# Altium schematic sheet УШЯИ411618.029 Э3 Лист3п(схема задания уровня).SchDoc
size 420 x 297 mm
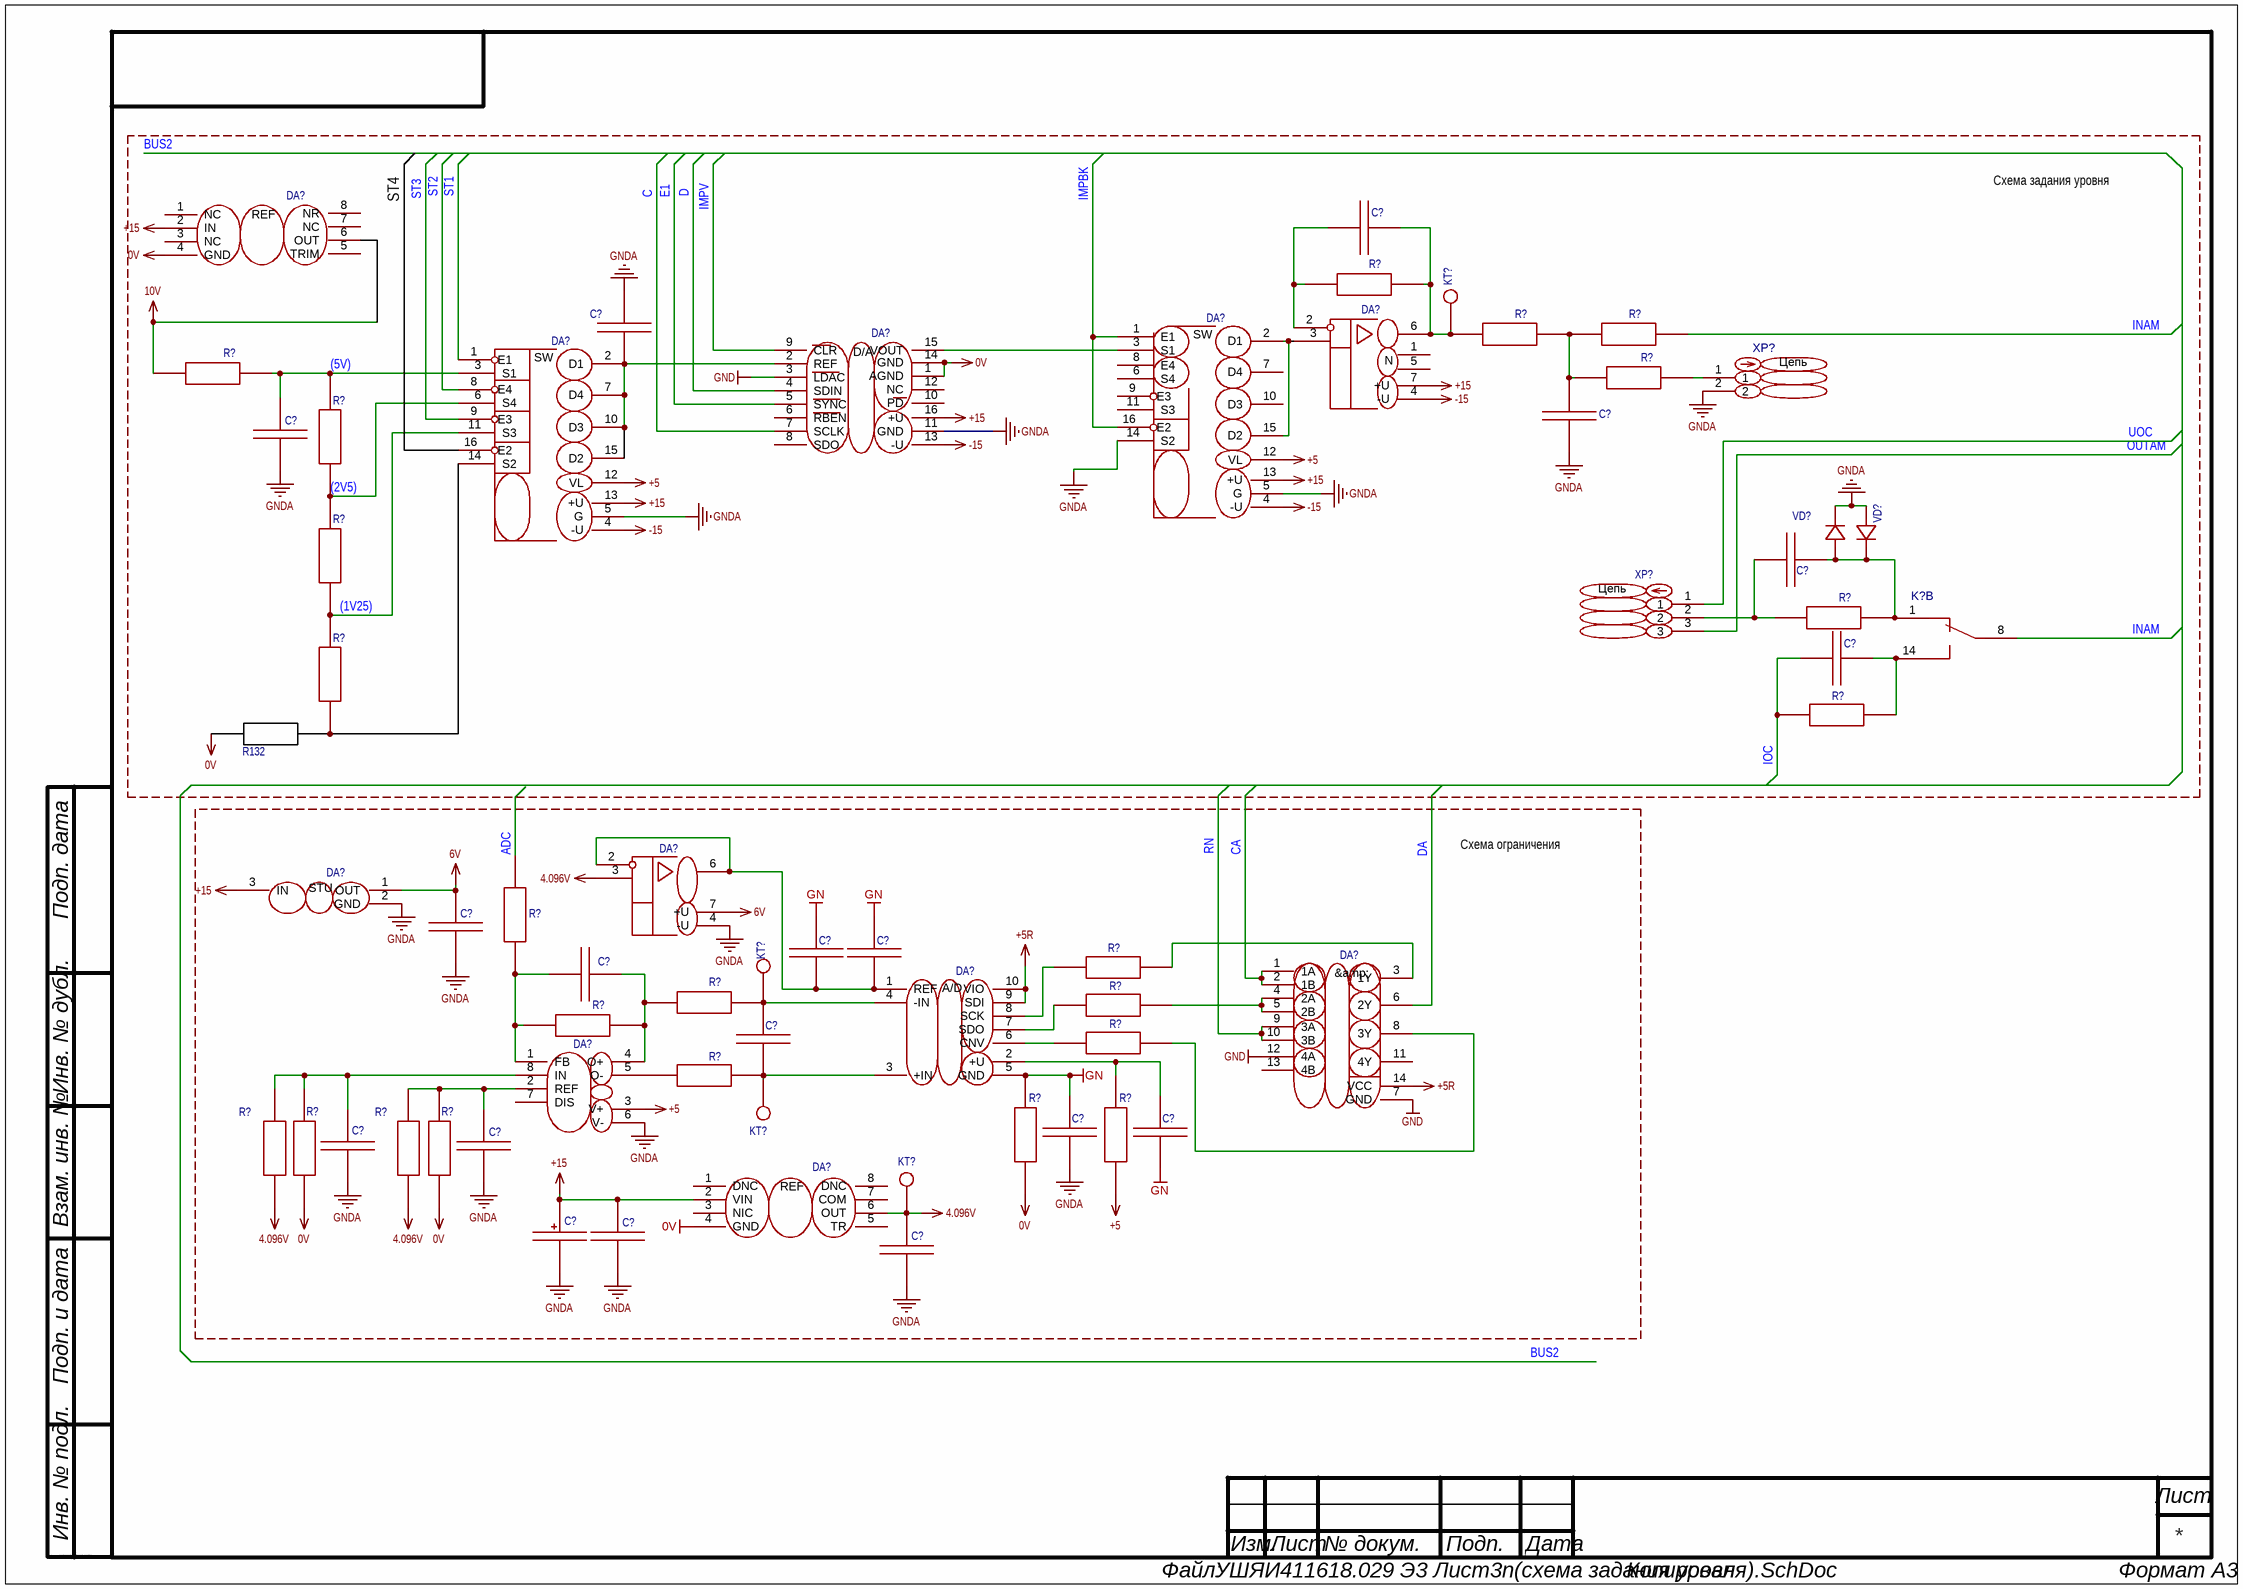
[diagram p0: УШЯИ411618.029 Э3 Лист3п(схема задания уровня).SchDoc]

## Parts
(Parts that share a designator on the sheet are numbered #1, #2 ... from top to bottom, then left to right.)
C?#1  Конденсатор SMD 10пФ 100В X7R 10% [0805]  [C0805]  (value not drawn)
C?#2  Конденсатор SMD 100нФ 100В X7R 10% [0805]  [C0805]  (value not drawn)
C?#3  Конденсатор SMD 5600пФ 100В X7R 10% [0805]  [C0805]  (value not drawn)
C?#4  Конденсатор SMD 100нФ 100В X7R 10% [0805]  [C0805]  (value not drawn)
C?#5  Конденсатор SMD 33пФ 100В X7R 10% [0805]  [C0805]  (value not drawn)
C?#6  Конденсатор SMD 22пФ 100В X7R 10% [0805]  [C0805]  (value not drawn)
C?#7  Конденсатор SMD 0.33мкФ 100В X7R 10% [0805]  [C0805]  (value not drawn)
C?#8  Конденсатор SMD 1мкФ 100В X7R 10% [1206]  [C1206]  (value not drawn)
C?#9  Конденсатор SMD 1мкФ 100В X7R 10% [1206]  [C1206]  (value not drawn)
C?#10  Конденсатор SMD 680пФ 100В X7R 10% [0805]  [C0805]  (value not drawn)
C?#11  Конденсатор SMD 9100пФ 100В X7R 10% [0805]  [C0805]  (value not drawn)
C?#12  Конденсатор SMD 1500пФ 100В X7R 10% [0805]  [C0805]  (value not drawn)
C?#13  Конденсатор SMD 2,2мкФ 100В X7R 10% [0805]  [C0805]  (value not drawn)
C?#14  Конденсатор SMD 100нФ 100В X7R 10% [0805]  [C0805]  (value not drawn)
C?#15  Конденсатор SMD 100нФ 100В X7R 10% [0805]  [C0805]  (value not drawn)
C?#16  TECAP, 4.7мкФ, 35В, тип C  [CASE-C_6032]  (value not drawn)
C?#17  Конденсатор SMD 0.33мкФ 100В X7R 10% [0805]  [C0805]  (value not drawn)
C?#18  Конденсатор SMD 100нФ 100В X7R 10% [0805]  [C0805]  (value not drawn)
DA?#1  Источник опорного напряжения AD587KNZ [DIP-8]  [PDIP-8_L9.3-W6.4-P2.54-LS7.9-BL-1]  (value not drawn)
DA?#2  Операционный усилитель ADA4627-1BRZ [SOIC-8]  [SOIC-8_L5.0-W4.0-P1.27-LS6.1-BL]  (value not drawn)
DA?#3  Цифроаналоговый преобразователь AD5531BRUZ [TSSOP-16]  [TSSOP-16_L5.0-W4.4-P0.65-LS6.4-BL]  (value not drawn)
DA?#4  Коммутатор аналоговых сигналов ADG433BRZ [SOIC-16]  [SOIC-16_L9.9-W3.9-P1.27-LS6.0-BL]  (value not drawn)
DA?#5  Коммутатор аналоговых сигналов ADG431BRZ [SOIC-16]  [SOIC-16_L9.9-W3.9-P1.27-LS6.0-BL]  (value not drawn)
DA?#6  Стабилизатор напряжения 78L06-300 [SOT-89]  [SOT-89-3_L4.5-W2.5-P1.50-LS4.2-BR]  (value not drawn)
DA?#7  Операционный усилитель AD8031 [SOIC-8]  [SOIC-8_L4.9-W3.9-P1.27-LS6.0-BL]  (value not drawn)
DA?#8  Дифференциальный АЦП АD7691 [MSOP-10]  [MSOP-10_L3.0-W3.0-P0.50-LS4.9-TL]  (value not drawn)
DA?#9  Логическая функция 2И 74HC08D,653 [SO-14]  [SOIC-14_L8.7-W3.9-P1.27-LS6.0-BL]  (value not drawn)
DA?#10  Дифференциальный драйвер 18-разрядных АЦП ADA4941-1YRZ [SOIC-8]  [SOIC-8_L4.9-W3.9-P1.27-LS6.0-BL]  (value not drawn)
DA?#11  Источник опопрного напряжения 4.096 V ADR434 [SOIC-8]  [SOIC-8_L4.9-W3.9-P1.27-LS6.0-BL]  (value not drawn)
K?  Реле герконовое DIP05-1C90-51L [PCB]  [Реле герконовое DIP05-1C90-51L [PCB]]  (value not drawn)  (part B of 2)
KT?#1  Control point  (value not drawn)
KT?#2  Control point  (value not drawn)
KT?#3  Control point  (value not drawn)
KT?#4  Control point  (value not drawn)
R132  Резистор 1кОм 0,125Вт 1% [0805]  [R0805]  (value not drawn)
R?#1  Резистор 120Ом 0.125Вт 1% [0805]  [R0805]  (value not drawn)
R?#2  Резистор 3,83кОм 0.25Вт 1% [1206]  [R1206]  (value not drawn)
R?#3  Резистор 4,99кОм 0.25Вт 1% [1206]  [R1206]  (value not drawn)
R?#4  Резистор 20кОм 0.25Вт 1% [1206]  [R1206]  (value not drawn)
R?#5  Резистор 3,83кОм 0.25Вт 1% [1206]  [R1206]  (value not drawn)
R?#6  Резистор 15кОм 0.25Вт 1% [1206]  [R1206]  (value not drawn)
R?#7  Резистор 1кОм 0.25Вт 1% [1206]  [R1206]  (value not drawn)
R?#8  Резистор 40,2кОм 0.25Вт 1% [1206]  [R1206]  (value not drawn)
R?#9  Резистор 3кОм 0.25Вт 1% [1206]  [R1206]  (value not drawn)
R?#10  Резистор 2кОм 0.25Вт 1% [1206]  [R1206]  (value not drawn)
R?#11  Резистор 20кОм 0.25Вт 1% [1206]  [R1206]  (value not drawn)
R?#12  Резистор 33Ом 0,125Вт 1% [0805]  [R0805]  (value not drawn)
R?#13  Резистор 33Ом 0,125Вт 1% [0805]  [R1206]  (value not drawn)
R?#14  Резистор 33Ом 0,125Вт 1% [0805]  [R0805]  (value not drawn)
R?#15  Резистор 14кОм 0.25Вт 1% [1206]  [R1206]  (value not drawn)
R?#16  Резистор 33Ом 0,125Вт 1% [0805]  [R0805]  (value not drawn)
R?#17  Резистор 33Ом 0,125Вт 1% [0805]  [R1206]  (value not drawn)
R?#18  Резистор 22Ом 0,125Вт 1% [0805]  [R0805]  (value not drawn)
R?#19  Резистор 15Ом 0,125Вт 1% [0805]  [R0805]  (value not drawn)
R?#20  Резистор 24,9кОм 0.25Вт 1% [1206]  [R1206]  (value not drawn)
R?#21  Резистор 11,8кОм 0.25Вт 1% [1206]  [R1206]  (value not drawn)
R?#22  Резистор 24,9кОм 0.25Вт 1% [1206]  [R1206]  (value not drawn)
R?#23  Резистор 30,1кОм 0.25Вт 1% [1206]  [R1206]  (value not drawn)
VD?#1  Диод импульсный 1N4448 [SOD-123]  [SOD-123_L2.7-W1.6-LS3.7-RD-1]  (value not drawn)
VD?#2  Диод импульсный 1N4448 [SOD-123]  [SOD-123_L2.7-W1.6-LS3.7-RD-1]  (value not drawn)
XP?#1  Вилка на плату 280370-2 шаг 2.54мм  [CONN-TH_280370-2]  (value not drawn)
XP?#2  Вилка на плату 826629-3 шаг 2.54мм  [HDR-TH_3P-P2.54-V-M-1]  (value not drawn)

## Blocks framed on the sheet
ST4: C?#1-C?#6 DA?#1-DA?#5 K? KT?#1 R132 R?#1-R?#10 VD?#1 VD?#2 XP?#1 XP?#2
Схема ограничения: C?#7-C?#18 DA?#6-DA?#11 KT?#2-KT?#4 R?#11-R?#23

## Nets
0V: DA?#1.4(GND) DA?#3.1(AGND) DA?#3.14(GND) DA?#11.4(GND) R132.1 R?#18.1 R?#21.1 R?#23.1
4.096V: C?#18.1 DA?#7.3(+IN) DA?#11.6(OUT) KT?#4.1 R?#20.1 R?#22.1
6V: C?#7.1 DA?#6.1(OUT) DA?#7.7(+U)
10V: DA?#1.6(OUT) R?#4.2
+5: DA?#4.12(VL) DA?#5.12(VL) DA?#10.3(V+) R?#19.1
+5R: DA?#8.9(SDI) DA?#8.10(VIO) DA?#9.14(VCC)
+15: C?#16.1 C?#17.1 DA?#1.2(IN) DA?#2.7(+U) DA?#3.16(+U) DA?#4.13(+U) DA?#5.13(+U) DA?#6.3(IN) DA?#11.2(VIN)
-15: DA?#2.4(-U) DA?#3.13(-U) DA?#4.4(-U) DA?#5.4(-U)
GN: C?#8.2 C?#9.2 C?#12.2 C?#13.1 DA?#8.5(GND) R?#18.2
GND: DA?#3.3(LDAC) DA?#9.7(GND) DA?#9.12(4A)
GNDA: C?#2.1 C?#3.1 C?#4.2 C?#7.2 C?#12.1 C?#14.2 C?#15.2 C?#16.2 C?#17.2 C?#18.2 DA?#3.11(GND) DA?#4.5(G) DA?#4.14(S2) DA?#5.5(G) DA?#6.2(GND) DA?#7.4(-U) DA?#10.6(V-) VD?#1.1(C) VD?#2.2(A) XP?#1.2
(1V25): DA?#5.11(S3) R?#7.1 R?#9.2
(2V5): DA?#5.6(S4) R?#6.1 R?#7.2
(5V): C?#4.1 DA?#5.3(S1) R?#4.1 R?#6.2
ADC: R?#11.2
C: DA?#3.7(SCLK)
CA: DA?#9.1(1A) DA?#9.2(1B)
D: DA?#3.4(SDIN)
DA: DA?#9.6(2Y)
E1: DA?#3.5(SYNC)
IMPBK: DA?#4.1(E1) DA?#4.16(E2)
IMPV: DA?#3.9(CLR)
INAM: K?.8 R?#3.2
IOC: C?#6.1 R?#10.1
OUTAM: XP?#2.3
RN: DA?#9.9(3A) DA?#9.10(3B)
ST1: DA?#5.1(E1)
ST2: DA?#5.8(E4)
ST3: DA?#5.9(E3)
UOC: XP?#2.1
NetC?#1_1: C?#1.1 DA?#2.2(-IN) R?#1.1
NetC?#1_2: C?#1.2 DA?#2.6(OUT) KT?#1.1 R?#1.2 R?#2.1
NetC?#2_2: C?#2.2 DA?#3.2(REF) DA?#5.2(D1) DA?#5.7(D4) DA?#5.10(D3) DA?#5.15(D2)
NetC?#3_2: C?#3.2 R?#2.2 R?#3.1 R?#5.2
NetC?#5_1: C?#5.1 R?#8.1 XP?#2.2
NetC?#5_2: C?#5.2 K?.1 R?#8.2 VD?#1.2(A) VD?#2.1(C)
NetC?#6_2: C?#6.2 K?.14 R?#10.2
NetC?#8_1: C?#8.1 C?#9.1 DA?#7.2(-IN) DA?#7.6(OUT) DA?#8.1(REF)
NetC?#10_1: C?#10.1 DA?#10.1(FB) R?#11.1 R?#15.1
NetC?#10_2: C?#10.2 DA?#10.4(O+) R?#13.2 R?#15.2
NetC?#11_1: C?#11.1 DA?#8.3(+IN) KT?#3.1 R?#17.1
NetC?#11_2: C?#11.2 DA?#8.4(-IN) KT?#2.1 R?#13.1
NetC?#13_2: C?#13.2 DA?#8.2(+U) R?#19.2
NetC?#14_1: C?#14.1 DA?#10.8(IN) R?#20.2 R?#21.2
NetC?#15_1: C?#15.1 DA?#10.2(REF) R?#22.2 R?#23.2
NetDA?#2_3: DA?#2.3(+IN) DA?#4.2(D1) DA?#4.15(D2)
NetDA?#3_15: DA?#3.15(VOUT) DA?#4.3(S1)
NetDA?#5_14: DA?#5.14(S2) R132.2 R?#9.1
NetDA?#8_6: DA?#8.6(CNV) R?#16.2
NetDA?#8_7: DA?#8.7(SDO) R?#14.2
NetDA?#8_8: DA?#8.8(SCK) R?#12.2
NetDA?#9_3: DA?#9.3(1Y) R?#12.1
NetDA?#9_4: DA?#9.4(2A) DA?#9.5(2B) R?#14.1
NetDA?#9_8: DA?#9.8(3Y) R?#16.1
NetDA?#10_5: DA?#10.5(O-) R?#17.2
NetR?#5_1: R?#5.1 XP?#1.1

Not connected (* = marked no-connect by the designer): DA?#1 1(NC) 3(NC) 5(TRIM) 7(NC) 8(NR); DA?#2 1(N) 5(N); DA?#3 6(RBEN) 8(SDO) 10(PD) 12(NC); DA?#4 6(S4) 7(D4) 8(E4) 9(E3) 10(D3) 11(S3); DA?#5 16(E2); DA?#9 11(4Y) 13(4B); DA?#10 7(DIS); DA?#11 1(DNC) 3(NIC) 5(TR) 7(COM) 8(DNC)

## Buses and harness runs
bus BUS2

## Notes on the sheet
- Схема задания уровня
- Подп. дата
- Инв. № дубл.
- Взам. инв. №
- Подп. и дата
- Инв. № подл.
- Изм.
- Лист
- № докум.
- Подп.
- Дата
- ALTIUM GOSTBOM2.0 KEV
- Файл:
- Копировал
- Формат А3
- (in symbol Вилка на плату 280370-2 шаг 2.54мм) Цепь
- (in symbol Вилка на плату 826629-3 шаг 2.54мм) Цепь
- (in symbol Дифференциальный АЦП АD7691 [MSOP-10]) A/D
- (in symbol Источник опопрного напряжения 4.096 V ADR434 [SOIC-8]) REF
- (in symbol Источник опорного напряжения AD587KNZ [DIP-8]) REF
- (in symbol Коммутатор аналоговых сигналов ADG431BRZ [SOIC-16]) SW
- (in symbol Коммутатор аналоговых сигналов ADG433BRZ [SOIC-16]) SW
- (in symbol Логическая функция 2И 74HC08D,653 [SO-14]) &amp;
- (in symbol Стабилизатор напряжения 78L06-300 [SOT-89]) STU
- (in symbol Цифроаналоговый преобразователь AD5531BRUZ [TSSOP-16]) D/A

## Library data of the parts
C?#1 = Конденсатор SMD 10пФ 100В X7R 10% [0805]: Contributor: jordanjin; Convert to PCB: yes; UniqueId: gge6408d63cc853d407; Origin Footprint: C0805; Device: Конденсатор SMD 10пФ 100В X7R 10% [0805]; Symbol: Конденсатор SMD 10пФ 100В X7R 10% [0805]; Manufacturer Part: C0805; spicePre: C; spiceSymbolName: Конденсатор SMD 100нФ 100В X7R 10% [0805]; Add into BOM: yes; FootprintName: C0805
C?#2 = Конденсатор SMD 100нФ 100В X7R 10% [0805]: Contributor: jordanjin; Convert to PCB: yes; UniqueId: gge9c67a6bb4fcd2d0a; Origin Footprint: C0805; Device: Конденсатор SMD 100нФ 100В X7R 10% [0805]; Symbol: Конденсатор SMD 100нФ 100В X7R 10% [0805]; Manufacturer Part: C0805; spicePre: C; spiceSymbolName: Конденсатор SMD 100нФ 100В X7R 10% [0805]; Add into BOM: yes; FootprintName: C0805
C?#3 = Конденсатор SMD 5600пФ 100В X7R 10% [0805]: Contributor: jordanjin; Convert to PCB: yes; UniqueId: ggee35e904d9e45dcff; Origin Footprint: C0805; Device: Конденсатор SMD 5600пФ 100В X7R 10% [0805]; Symbol: Конденсатор SMD 5600пФ 100В X7R 10% [0805]; Manufacturer Part: C0805; spicePre: C; spiceSymbolName: Конденсатор SMD 100нФ 100В X7R 10% [0805]; Add into BOM: yes; FootprintName: C0805
C?#4 = Конденсатор SMD 100нФ 100В X7R 10% [0805]: Contributor: jordanjin; Convert to PCB: yes; UniqueId: gge610d07ec82ed99e2; Origin Footprint: C0805; Device: Конденсатор SMD 100нФ 100В X7R 10% [0805]; Symbol: Конденсатор SMD 100нФ 100В X7R 10% [0805]; Manufacturer Part: C0805; spicePre: C; spiceSymbolName: Конденсатор SMD 100нФ 100В X7R 10% [0805]; Add into BOM: yes; FootprintName: C0805
C?#5 = Конденсатор SMD 33пФ 100В X7R 10% [0805]: Contributor: jordanjin; Convert to PCB: yes; UniqueId: gge74ff06e723770230; Origin Footprint: C0805; Device: Конденсатор SMD 33пФ 100В X7R 10% [0805]; Symbol: Конденсатор SMD 33пФ 100В X7R 10% [0805]; Manufacturer Part: C0805; spicePre: C; spiceSymbolName: Конденсатор SMD 100нФ 100В X7R 10% [0805]; Add into BOM: yes; FootprintName: C0805
C?#6 = Конденсатор SMD 47пФ 100В X7R 10% [0805]: Contributor: jordanjin; Convert to PCB: yes; UniqueId: ggebcdf9166f131ad3e; Origin Footprint: C0805; Device: Конденсатор SMD 47пФ 100В X7R 10% [0805]; Symbol: Конденсатор SMD 47пФ 100В X7R 10% [0805]; Manufacturer Part: C0805; spicePre: C; spiceSymbolName: Конденсатор SMD 100нФ 100В X7R 10% [0805]; Add into BOM: yes; FootprintName: C0805
C?#7 = Конденсатор SMD 0.33мкФ 100В X7R 10% [0805]: Contributor: jordanjin; Convert to PCB: yes; UniqueId: gge3027680270fc1593; Origin Footprint: C0805; Device: Конденсатор SMD 0.33мкФ 100В X7R 10% [0805]; Symbol: Конденсатор SMD 0.33мкФ 100В X7R 10% [0805]; Manufacturer Part: C0805; spicePre: C; spiceSymbolName: Конденсатор SMD 100нФ 100В X7R 10% [0805]; Add into BOM: yes; FootprintName: C0805
C?#8 = Конденсатор SMD 1мкФ 100В X7R 10% [1206]: Contributor: jordanjin; Convert to PCB: yes; UniqueId: gge7874448dced5ad97; Origin Footprint: C1206; Device: Конденсатор SMD 1мкФ 100В X7R 10% [1206]; Symbol: Конденсатор SMD 1мкФ 100В X7R 10% [1206]; Manufacturer Part: C1206; spicePre: C; spiceSymbolName: Конденсатор SMD 100нФ 100В X7R 10% [1206]; Add into BOM: yes; FootprintName: C1206
C?#9 = Конденсатор SMD 1мкФ 100В X7R 10% [1206]: Contributor: jordanjin; Convert to PCB: yes; UniqueId: ggeeff5ebe028285b3e; Origin Footprint: C1206; Device: Конденсатор SMD 1мкФ 100В X7R 10% [1206]; Symbol: Конденсатор SMD 1мкФ 100В X7R 10% [1206]; Manufacturer Part: C1206; spicePre: C; spiceSymbolName: Конденсатор SMD 100нФ 100В X7R 10% [1206]; Add into BOM: yes; FootprintName: C1206
C?#10 = Конденсатор SMD 680пФ 100В X7R 10% [0805]: Contributor: jordanjin; Convert to PCB: yes; UniqueId: ggee46bcfb34e487613; Origin Footprint: C0805; Device: Конденсатор SMD 680пФ 100В X7R 10% [0805]; Symbol: Конденсатор SMD 680пФ 100В X7R 10% [0805]; Manufacturer Part: C0805; spicePre: C; spiceSymbolName: Конденсатор SMD 100нФ 100В X7R 10% [0805]; Add into BOM: yes; FootprintName: C0805
C?#11 = Конденсатор SMD 9100пФ 100В X7R 10% [0805]: Contributor: jordanjin; Convert to PCB: yes; UniqueId: ggeaca6435958f86383; Origin Footprint: C0805; Device: Конденсатор SMD 9100пФ 100В X7R 10% [0805]; Symbol: Конденсатор SMD 9100пФ 100В X7R 10% [0805]; Manufacturer Part: C0805; spicePre: C; spiceSymbolName: Конденсатор SMD 100нФ 100В X7R 10% [0805]; Add into BOM: yes; FootprintName: C0805
C?#12 = Конденсатор SMD 1500пФ 100В X7R 10% [0805]: Contributor: jordanjin; Convert to PCB: yes; UniqueId: gge738013eea0431644; Origin Footprint: C0805; Device: Конденсатор SMD 1500пФ 100В X7R 10% [0805]; Symbol: Конденсатор SMD 1500пФ 100В X7R 10% [0805]; Manufacturer Part: C0805; spicePre: C; spiceSymbolName: Конденсатор SMD 100нФ 100В X7R 10% [0805]; Add into BOM: yes; FootprintName: C0805
C?#13 = Конденсатор SMD 2,2мкФ 100В X7R 10% [0805]: Contributor: jordanjin; Convert to PCB: yes; UniqueId: gge0d32fd6a7c96d400; Origin Footprint: C0805; Device: Конденсатор SMD 2,2мкФ 100В X7R 10% [0805]; Symbol: Конденсатор SMD 2,2мкФ 100В X7R 10% [0805]; Manufacturer Part: C0805; spicePre: C; spiceSymbolName: Конденсатор SMD 100нФ 100В X7R 10% [0805]; Add into BOM: yes; FootprintName: C0805
C?#14 = Конденсатор SMD 100нФ 100В X7R 10% [0805]: Contributor: jordanjin; Convert to PCB: yes; UniqueId: ggef6da372763917921; Origin Footprint: C0805; Device: Конденсатор SMD 100нФ 100В X7R 10% [0805]; Symbol: Конденсатор SMD 100нФ 100В X7R 10% [0805]; Manufacturer Part: C0805; spicePre: C; spiceSymbolName: Конденсатор SMD 100нФ 100В X7R 10% [0805]; Add into BOM: yes; FootprintName: C0805
C?#15 = Конденсатор SMD 100нФ 100В X7R 10% [0805]: Contributor: jordanjin; Convert to PCB: yes; UniqueId: gge84b8ee80d83a6db3; Origin Footprint: C0805; Device: Конденсатор SMD 100нФ 100В X7R 10% [0805]; Symbol: Конденсатор SMD 100нФ 100В X7R 10% [0805]; Manufacturer Part: C0805; spicePre: C; spiceSymbolName: Конденсатор SMD 100нФ 100В X7R 10% [0805]; Add into BOM: yes; FootprintName: C0805
C?#16 = TECAP, 4.7мкФ, 35В, тип C: Manufacturer: Kyocera AVX; Manufacturer Part: TECAP, 100мкФ, 10В, тип C; nameAlias: Value; Contributor: jordanjin; Convert to PCB: yes; UniqueId: ggeb894a7cfd837db3e; Origin Footprint: CASE-C_6032; Device: TECAP, 4.7мкФ, 35В, тип C; Symbol: TECAP, 4.7мкФ, 35В, тип C; Supplier: LCSC; Supplier Part: C273664; JLCPCB Part Class: Extended Part; spicePre: C; spiceSymbolName: TECAP, 100мкФ, 10В, тип C; Add into BOM: yes; FootprintName: CASE-C_6032
C?#17 = Конденсатор SMD 0.33мкФ 100В X7R 10% [0805]: Contributor: jordanjin; Convert to PCB: yes; UniqueId: gge98cf81a33b76d68b; Origin Footprint: C0805; Device: Конденсатор SMD 0.33мкФ 100В X7R 10% [0805]; Symbol: Конденсатор SMD 0.33мкФ 100В X7R 10% [0805]; Manufacturer Part: C0805; spicePre: C; spiceSymbolName: Конденсатор SMD 100нФ 100В X7R 10% [0805]; Add into BOM: yes; FootprintName: C0805
C?#18 = Конденсатор SMD 100нФ 100В X7R 10% [0805]: Contributor: jordanjin; Convert to PCB: yes; UniqueId: gge757bc79d223d3177; Origin Footprint: C0805; Device: Конденсатор SMD 100нФ 100В X7R 10% [0805]; Symbol: Конденсатор SMD 100нФ 100В X7R 10% [0805]; Manufacturer Part: C0805; spicePre: C; spiceSymbolName: Конденсатор SMD 100нФ 100В X7R 10% [0805]; Add into BOM: yes; FootprintName: C0805
DA?#1 = Источник опорного напряжения AD587KNZ [DIP-8]: Manufacturer: Analog Devices; Contributor: jordanjin; Convert to PCB: yes; UniqueId: gge3ea31b7bc5ba7302; ModelId: 0a905fe212f04dd58d97e47ae0145e08; Origin Footprint: PDIP-8_L9.3-W6.4-P2.54-LS7.9-BL-1; Device: Источник опорного напряжения AD587KNZ [DIP-8]; Symbol: Источник опорного напряжения AD587KNZ [DIP-8]; Supplier: LCSC; Manufacturer Part: AD587KNZ; JLCPCB Part Class: Extended Part; spicePre: D; spiceSymbolName: Источник опорного напряжения AD587KNZ [DIP-8]; Add into BOM: yes; FootprintName: PDIP-8_L9.3-W6.4-P2.54-LS7.9-BL-1; ModelName: PDIP-8_L9.3-W6.4-P2.54-LS7.9-BL-1
DA?#2 = Операционный усилитель ADA4627-1BRZ [SOIC-8]: Manufacturer: Analog Devices; Contributor: jordanjin; Convert to PCB: yes; UniqueId: gge5d573c7ee08cf7f6; ModelId: 08ee08ca4db744298953d7a1ad16709b; Origin Footprint: SOIC-8_L5.0-W4.0-P1.27-LS6.1-BL; Device: Операционный усилитель ADA4627-1BRZ [SOIC-8]; Symbol: Операционный усилитель ADA4627-1BRZ [SOIC-8]; Supplier: LCSC; Manufacturer Part: ADA4627-1BRZ; JLCPCB Part Class: Extended Part; spicePre: D; spiceSymbolName: Операционный усилитель ADA4627-1BRZ [SOIC-8]; Add into BOM: yes; FootprintName: SOIC-8_L5.0-W4.0-P1.27-LS6.1-BL; ModelName: SOIC-8_L5.0-W4.0-P1.27-LS6.1-BL
DA?#3 = Цифроаналоговый преобразователь AD5531BRUZ [TSSOP-16]: Manufacturer: Analog Devices; Manufacturer Part: AD5531BRUZ-REEL7; Contributor: jordanjin; Convert to PCB: yes; UniqueId: gge0e7443f72cb61633; Origin Footprint: TSSOP-16_L5.0-W4.4-P0.65-LS6.4-BL; Device: Цифроаналоговый преобразователь AD5531BRUZ [TSSOP-16]; Symbol: Цифроаналоговый преобразователь AD5531BRUZ [TSSOP-16]; Supplier: LCSC; Supplier Part: C578208; JLCPCB Part Class: Extended Part; spicePre: D; spiceSymbolName: Цифроаналоговый преобразователь AD5531BRUZ [TSSOP-16]; Add into BOM: yes; FootprintName: TSSOP-16_L5.0-W4.4-P0.65-LS6.4-BL
DA?#4 = Коммутатор аналоговых сигналов ADG433BRZ [SOIC-16]: Manufacturer: Analog Devices; Manufacturer Part: ADG433BRZ-REEL; Contributor: jordanjin; Convert to PCB: yes; UniqueId: gge4be3ddaa9aa1b4ea; Origin Footprint: SOIC-16_L9.9-W3.9-P1.27-LS6.0-BL; Device: Коммутатор аналоговых сигналов ADG433BRZ [SOIC-16]; Symbol: Коммутатор аналоговых сигналов ADG433BRZ [SOIC-16]; Supplier: LCSC; Supplier Part: C655338; JLCPCB Part Class: Extended Part; spicePre: D; spiceSymbolName: Коммутатор аналоговых сигналов ADG433BRZ [SOIC-16]; Add into BOM: yes; FootprintName: SOIC-16_L9.9-W3.9-P1.27-LS6.0-BL
DA?#5 = Коммутатор аналоговых сигналов ADG431BRZ [SOIC-16]: Manufacturer: Analog Devices; Contributor: jordanjin; Convert to PCB: yes; UniqueId: gge69d42b7b9fe55c41; Origin Footprint: SOIC-16_L9.9-W3.9-P1.27-LS6.0-BL; Device: Коммутатор аналоговых сигналов ADG431BRZ [SOIC-16]; Symbol: Коммутатор аналоговых сигналов ADG431BRZ [SOIC-16]; Supplier: LCSC; Supplier Part: C208635; Manufacturer Part: ADG431BRZ; JLCPCB Part Class: Extended Part; spicePre: D; spiceSymbolName: Коммутатор аналоговых сигналов ADG431BRZ [SOIC-16]; Add into BOM: yes; FootprintName: SOIC-16_L9.9-W3.9-P1.27-LS6.0-BL
DA?#6 = Стабилизатор напряжения 78L06-300 [SOT-89]: Manufacturer: UMW; Contributor: jordanjin; Convert to PCB: yes; UniqueId: gge7fb4a5574cb8e1f8; Origin Footprint: SOT-89-3_L4.5-W2.5-P1.50-LS4.2-BR; Device: Стабилизатор напряжения 78L06-300 [SOT-89]; Symbol: Стабилизатор напряжения 78L06-300 [SOT-89]; Supplier: LCSC; Manufacturer Part: 78L06-300; JLCPCB Part Class: Extended Part; spicePre: D; spiceSymbolName: Стабилизатор напряжения 78L06-300 [SOT-89]; Add into BOM: yes; FootprintName: SOT-89-3_L4.5-W2.5-P1.50-LS4.2-BR
DA?#7 = Операционный усилитель AD8031 [SOIC-8]: Manufacturer: Analog Devices; Manufacturer Part: AD8031BRZ-REEL7; Contributor: jordanjin; Convert to PCB: yes; UniqueId: gge62cd891aac0fc93c; Origin Footprint: SOIC-8_L4.9-W3.9-P1.27-LS6.0-BL; Device: Операционный усилитель AD8031 [SOIC-8]; Symbol: Операционный усилитель AD8031 [SOIC-8]; Supplier: LCSC; Supplier Part: C56309; JLCPCB Part Class: Extended Part; spicePre: D; spiceSymbolName: Операционный усилитель AD8031 [SOIC-8]; Add into BOM: yes; FootprintName: SOIC-8_L4.9-W3.9-P1.27-LS6.0-BL
DA?#8 = Дифференциальный АЦП АD7691 [MSOP-10]: Manufacturer: Analog Devices; Contributor: jordanjin; Convert to PCB: yes; UniqueId: gge26c0700bfbd06f0d; ModelId: 8dddc987df624b228af477f4d4234e3c; Origin Footprint: MSOP-10_L3.0-W3.0-P0.50-LS4.9-TL; Device: Дифференциальный АЦП АD7691 [MSOP-10]; Symbol: Дифференциальный АЦП АD7691 [MSOP-10]; spicePre: D; spiceSymbolName: Дифференциальный АЦП АD7691 [MSOP-10]; Add into BOM: yes; FootprintName: MSOP-10_L3.0-W3.0-P0.50-LS4.9-TL; ModelName: MSOP-10_L3.0-W3.0-P0.50-LS4.9-TL
DA?#9 = Логическая функция 2И 74HC08D,653 [SO-14]: Manufacturer: Nexperia; Contributor: jordanjin; Convert to PCB: yes; UniqueId: gge10e058de012b6629; Origin Footprint: SOIC-14_L8.7-W3.9-P1.27-LS6.0-BL; Device: Логическая функция 2И 74HC08D,653 [SO-14]; Symbol: Логическая функция 2И 74HC08D,653 [SO-14]; Supplier: LCSC; Manufacturer Part: 74HC08D,653; JLCPCB Part Class: Extended Part; spicePre: D; spiceSymbolName: Логическая функция 2И 74HC08D,653 [SO-14]; Add into BOM: yes; FootprintName: SOIC-14_L8.7-W3.9-P1.27-LS6.0-BL
DA?#10 = Дифференциальный драйвер 18-разрядных АЦП ADA4941-1YRZ [SOIC-8]: Manufacturer: Analog Devices; Contributor: jordanjin; Convert to PCB: yes; UniqueId: ggeec733bf2f64a91bf; Origin Footprint: SOIC-8_L4.9-W3.9-P1.27-LS6.0-BL; Device: Дифференциальный драйвер 18-разрядных АЦП ADA4941-1YRZ [SOIC-8]; Symbol: Дифференциальный драйвер 18-разрядных АЦП ADA4941-1YRZ [SOIC-8]; Supplier: LCSC; Manufacturer Part: ADA4941-1YRZ; JLCPCB Part Class: Extended Part; spicePre: D; spiceSymbolName: Дифференциальный драйвер 18-разрядных АЦП ADA4941-1YRZ [SOIC-8]; Add into BOM: yes; FootprintName: SOIC-8_L4.9-W3.9-P1.27-LS6.0-BL
DA?#11 = Источник опопрного напряжения 4.096 V ADR434 [SOIC-8]: Manufacturer: Analog Devices; Contributor: jordanjin; Convert to PCB: yes; UniqueId: ggeae212be344de7ac5; Origin Footprint: SOIC-8_L4.9-W3.9-P1.27-LS6.0-BL; Device: Источник опопрного напряжения 4.096 V ADR434 [SOIC-8]; Symbol: Источник опопрного напряжения 4.096 V ADR434 [SOIC-8]; Supplier: LCSC; Manufacturer Part: ADR434; JLCPCB Part Class: Extended Part; spicePre: D; spiceSymbolName: Источник опопрного напряжения 4.096 V ADR434 [SOIC-8]; Add into BOM: yes; FootprintName: SOIC-8_L4.9-W3.9-P1.27-LS6.0-BL
K? = Реле герконовое DIP05-1C90-51L [PCB]: Manufacturer: STANDEXMEDER; subpart_no: 1; Origin Footprint: RELAY-TH_STANDEXMEDER_DIP05-1C90-51L; Contributor: jordanjin; Convert to PCB: yes; UniqueId: gge6178cdef53ee876f; ModelId: 9ce20f042c4243a9be1ebcff3b9f4bf9; Device: Реле герконовое DIP05-1C90-51L [PCB]; Symbol: Реле герконовое DIP05-1C90-51L [PCB]; Supplier: LCSC; Manufacturer Part: DIP05-1C90-51L; JLCPCB Part Class: Extended Part; spicePre: K; spiceSymbolName: Реле герконовое DIP05-1C90-51L [PCB]; Add into BOM: yes; FootprintName: RELAY-TH_STANDEXMEDER_DIP05-1C90-51L; ModelName: RELAY-TH_STANDEXMEDER_DIP05-1C90-51L
KT?#1 = Control point: Contributor: jordanjin; Convert to PCB: yes; UniqueId: gge7292ed09fd448b11; Origin Footprint: CONTROL POINT; Device: Control point; Symbol: Control point; Manufacturer Part: Control point; spicePre: K; spiceSymbolName: Control point; Add into BOM: yes
KT?#2 = Control point: Contributor: jordanjin; Convert to PCB: yes; UniqueId: gge883ca878b3b38f22; Origin Footprint: CONTROL POINT; Device: Control point; Symbol: Control point; Manufacturer Part: Control point; spicePre: K; spiceSymbolName: Control point; Add into BOM: yes
KT?#3 = Control point: Contributor: jordanjin; Convert to PCB: yes; UniqueId: gge961df7385aab1647; Origin Footprint: CONTROL POINT; Device: Control point; Symbol: Control point; Manufacturer Part: Control point; spicePre: K; spiceSymbolName: Control point; Add into BOM: yes
KT?#4 = Control point: Contributor: jordanjin; Convert to PCB: yes; UniqueId: ggef98eb2457b3a2db3; Origin Footprint: CONTROL POINT; Device: Control point; Symbol: Control point; Manufacturer Part: Control point; spicePre: K; spiceSymbolName: Control point; Add into BOM: yes
R132 = Резистор 100Ом 0,125Вт 1% [DIP]: Origin Footprint: R0.125W; Contributor: jordanjin; Convert to PCB: yes; UniqueId: ggee36e9b7f0e93b298; Device: Резистор 100Ом 0,125Вт 1% [DIP]; Symbol: Резистор 100Ом 0,125Вт 1% [DIP]; Manufacturer Part: R0805; spicePre: R; spiceSymbolName: Резистор 100Ом 0,125Вт 1% [DIP]; Add into BOM: yes
R?#1 = Резистор 120Ом 0.125Вт 1% [0805]: Contributor: jordanjin; Convert to PCB: yes; UniqueId: ggec09913ea7eed3e21; ModelId: de27d504f5024d53a3020ec2611f5e5e; Origin Footprint: R0805; Device: Резистор 120Ом 0.125Вт 1% [0805]; Symbol: Резистор 120Ом 0.125Вт 1% [0805]; Manufacturer Part: R0805; spicePre: R; spiceSymbolName: Резистор 12кОм 0,25Вт 1% [1206]; Add into BOM: yes; FootprintName: R0805; ModelName: R0805
R?#2 = Резистор 3,83кОм 0.25Вт 1% [1206]: Contributor: jordanjin; Convert to PCB: yes; UniqueId: gge8a5aa154aa04bbdd; Origin Footprint: R1206; Device: Резистор 3,83кОм 0.25Вт 1% [1206]; Symbol: Резистор 3,83кОм 0.25Вт 1% [1206]; Manufacturer Part: R1206; spicePre: R; spiceSymbolName: Резистор 12кОм 0,25Вт 1% [1206]; Add into BOM: yes; FootprintName: R1206
R?#3 = Резистор 4,99кОм 0.25Вт 1% [1206]: Contributor: jordanjin; Convert to PCB: yes; UniqueId: gge0b815d0e47bf766f; Origin Footprint: R1206; Device: Резистор 4,99кОм 0.25Вт 1% [1206]; Symbol: Резистор 4,99кОм 0.25Вт 1% [1206]; Manufacturer Part: R1206; spicePre: R; spiceSymbolName: Резистор 12кОм 0,25Вт 1% [1206]; Add into BOM: yes; FootprintName: R1206
R?#4 = Резистор 10кОм 0.25Вт 1% [1206]: Contributor: jordanjin; Convert to PCB: yes; UniqueId: gge7d518c35428b98fb; Origin Footprint: R1206; Device: Резистор 10кОм 0.25Вт 1% [1206]; Symbol: Резистор 10кОм 0.25Вт 1% [1206]; Manufacturer Part: R1206; spicePre: R; spiceSymbolName: Резистор 12кОм 0,25Вт 1% [1206]; Add into BOM: yes; FootprintName: R1206
R?#5 = Резистор 3,83кОм 0.25Вт 1% [1206]: Contributor: jordanjin; Convert to PCB: yes; UniqueId: ggec56ea112b2cd7263; Origin Footprint: R1206; Device: Резистор 3,83кОм 0.25Вт 1% [1206]; Symbol: Резистор 3,83кОм 0.25Вт 1% [1206]; Manufacturer Part: R1206; spicePre: R; spiceSymbolName: Резистор 12кОм 0,25Вт 1% [1206]; Add into BOM: yes; FootprintName: R1206
R?#6 = Резистор 4,99кОм 0.25Вт 1% [1206]: Contributor: jordanjin; Convert to PCB: yes; UniqueId: gge589878778ccb2ddd; Origin Footprint: R1206; Device: Резистор 4,99кОм 0.25Вт 1% [1206]; Symbol: Резистор 4,99кОм 0.25Вт 1% [1206]; Manufacturer Part: R1206; spicePre: R; spiceSymbolName: Резистор 12кОм 0,25Вт 1% [1206]; Add into BOM: yes; FootprintName: R1206
R?#7 = Резистор 2,49кОм 0.25Вт 1% [1206]: Contributor: jordanjin; Convert to PCB: yes; UniqueId: gge078efca5cbc8d300; Origin Footprint: R1206; Device: Резистор 2,49кОм 0.25Вт 1% [1206]; Symbol: Резистор 2,49кОм 0.25Вт 1% [1206]; Manufacturer Part: R1206; spicePre: R; spiceSymbolName: Резистор 12кОм 0,25Вт 1% [1206]; Add into BOM: yes; FootprintName: R1206
R?#8 = Резистор 40,2кОм 0.25Вт 1% [1206]: Contributor: jordanjin; Convert to PCB: yes; UniqueId: ggec73dbedad6f0ecfe; Origin Footprint: R1206; Device: Резистор 40,2кОм 0.25Вт 1% [1206]; Symbol: Резистор 40,2кОм 0.25Вт 1% [1206]; Manufacturer Part: R1206; spicePre: R; spiceSymbolName: Резистор 12кОм 0,25Вт 1% [1206]; Add into BOM: yes; FootprintName: R1206
R?#9 = Резистор 2,49кОм 0.25Вт 1% [1206]: Contributor: jordanjin; Convert to PCB: yes; UniqueId: gge3a96a5cf86464f58; Origin Footprint: R1206; Device: Резистор 2,49кОм 0.25Вт 1% [1206]; Symbol: Резистор 2,49кОм 0.25Вт 1% [1206]; Manufacturer Part: R1206; spicePre: R; spiceSymbolName: Резистор 12кОм 0,25Вт 1% [1206]; Add into BOM: yes; FootprintName: R1206
R?#10 = Резистор 402Ом 0.25Вт 1% [1206]: Contributor: jordanjin; Convert to PCB: yes; UniqueId: gged6c32bc60b8fe393; Origin Footprint: R1206; Device: Резистор 402Ом 0.25Вт 1% [1206]; Symbol: Резистор 402Ом 0.25Вт 1% [1206]; Manufacturer Part: R1206; spicePre: R; spiceSymbolName: Резистор 12кОм 0,25Вт 1% [1206]; Add into BOM: yes; FootprintName: R1206
R?#11 = Резистор 20кОм 0.25Вт 1% [1206]: Contributor: jordanjin; Convert to PCB: yes; UniqueId: gge53adf15c978c91af; Origin Footprint: R1206; Device: Резистор 20кОм 0.25Вт 1% [1206]; Symbol: Резистор 20кОм 0.25Вт 1% [1206]; Manufacturer Part: R1206; spicePre: R; spiceSymbolName: Резистор 12кОм 0,25Вт 1% [1206]; Add into BOM: yes; FootprintName: R1206
R?#12 = Резистор 33Ом 0,125Вт 1% [0805]: Contributor: jordanjin; Convert to PCB: yes; UniqueId: ggeff7e93c13db49d2e; ModelId: de27d504f5024d53a3020ec2611f5e5e; Origin Footprint: R0805; Device: Резистор 33Ом 0,125Вт 1% [0805]; Symbol: Резистор 33Ом 0,125Вт 1% [0805]; Manufacturer Part: R0805; spicePre: R; spiceSymbolName: Резистор 12кОм 0,125Вт 1% [0805]; Add into BOM: yes; FootprintName: R0805; ModelName: R0805
R?#13 = Резистор 33Ом 0,125Вт 1% [0805]: Contributor: jordanjin; Convert to PCB: yes; UniqueId: gge62f4812832a07bf9; Origin Footprint: R1206; Device: Резистор 33Ом 0,125Вт 1% [0805]; Symbol: Резистор 33Ом 0,125Вт 1% [0805]; Manufacturer Part: R1206; spicePre: R; spiceSymbolName: Резистор 12кОм 0,25Вт 1% [1206]; Add into BOM: yes; FootprintName: R1206
R?#14 = Резистор 33Ом 0,125Вт 1% [0805]: Contributor: jordanjin; Convert to PCB: yes; UniqueId: ggecb27557eec313eea; ModelId: de27d504f5024d53a3020ec2611f5e5e; Origin Footprint: R0805; Device: Резистор 33Ом 0,125Вт 1% [0805]; Symbol: Резистор 33Ом 0,125Вт 1% [0805]; Manufacturer Part: R0805; spicePre: R; spiceSymbolName: Резистор 12кОм 0,125Вт 1% [0805]; Add into BOM: yes; FootprintName: R0805; ModelName: R0805
R?#15 = Резистор 14кОм 0.25Вт 1% [1206]: Contributor: jordanjin; Convert to PCB: yes; UniqueId: gge5b30a2df6d1a0edd; Origin Footprint: R1206; Device: Резистор 14кОм 0.25Вт 1% [1206]; Symbol: Резистор 14кОм 0.25Вт 1% [1206]; Manufacturer Part: R1206; spicePre: R; spiceSymbolName: Резистор 12кОм 0,25Вт 1% [1206]; Add into BOM: yes; FootprintName: R1206
R?#16 = Резистор 33Ом 0,125Вт 1% [0805]: Contributor: jordanjin; Convert to PCB: yes; UniqueId: ggeca7bef7df240af7e; ModelId: de27d504f5024d53a3020ec2611f5e5e; Origin Footprint: R0805; Device: Резистор 33Ом 0,125Вт 1% [0805]; Symbol: Резистор 33Ом 0,125Вт 1% [0805]; Manufacturer Part: R0805; spicePre: R; spiceSymbolName: Резистор 12кОм 0,125Вт 1% [0805]; Add into BOM: yes; FootprintName: R0805; ModelName: R0805
R?#17 = Резистор 33Ом 0,125Вт 1% [0805]: Contributor: jordanjin; Convert to PCB: yes; UniqueId: gge656d60c37132ad6e; Origin Footprint: R1206; Device: Резистор 33Ом 0,125Вт 1% [0805]; Symbol: Резистор 33Ом 0,125Вт 1% [0805]; Manufacturer Part: R1206; spicePre: R; spiceSymbolName: Резистор 12кОм 0,25Вт 1% [1206]; Add into BOM: yes; FootprintName: R1206
R?#18 = Резистор 22Ом 0,125Вт 1% [0805]: Contributor: jordanjin; Convert to PCB: yes; UniqueId: ggede35cff75efacecb; ModelId: de27d504f5024d53a3020ec2611f5e5e; Origin Footprint: R0805; Device: Резистор 22Ом 0,125Вт 1% [0805]; Symbol: Резистор 22Ом 0,125Вт 1% [0805]; Manufacturer Part: R0805; spicePre: R; spiceSymbolName: Резистор 12кОм 0,125Вт 1% [0805]; Add into BOM: yes; FootprintName: R0805; ModelName: R0805
R?#19 = Резистор 15Ом 0,125Вт 1% [0805]: Contributor: jordanjin; Convert to PCB: yes; UniqueId: ggef69317e34cb5bd2a; ModelId: de27d504f5024d53a3020ec2611f5e5e; Origin Footprint: R0805; Device: Резистор 15Ом 0,125Вт 1% [0805]; Symbol: Резистор 15Ом 0,125Вт 1% [0805]; Manufacturer Part: R0805; spicePre: R; spiceSymbolName: Резистор 12кОм 0,125Вт 1% [0805]; Add into BOM: yes; FootprintName: R0805; ModelName: R0805
R?#20 = Резистор 24,9кОм 0.25Вт 1% [1206]: Contributor: jordanjin; Convert to PCB: yes; UniqueId: ggef60ac22bde86f3e6; Origin Footprint: R1206; Device: Резистор 24,9кОм 0.25Вт 1% [1206]; Symbol: Резистор 24,9кОм 0.25Вт 1% [1206]; Manufacturer Part: R1206; spicePre: R; spiceSymbolName: Резистор 12кОм 0,25Вт 1% [1206]; Add into BOM: yes; FootprintName: R1206
R?#21 = Резистор 11,8кОм 0.25Вт 1% [1206]: Contributor: jordanjin; Convert to PCB: yes; UniqueId: ggeb8daf8ef1d3139e0; Origin Footprint: R1206; Device: Резистор 11,8кОм 0.25Вт 1% [1206]; Symbol: Резистор 11,8кОм 0.25Вт 1% [1206]; Manufacturer Part: R1206; spicePre: R; spiceSymbolName: Резистор 12кОм 0,25Вт 1% [1206]; Add into BOM: yes; FootprintName: R1206
R?#22 = Резистор 24,9кОм 0.25Вт 1% [1206]: Contributor: jordanjin; Convert to PCB: yes; UniqueId: gge53ffcd035831015b; Origin Footprint: R1206; Device: Резистор 24,9кОм 0.25Вт 1% [1206]; Symbol: Резистор 24,9кОм 0.25Вт 1% [1206]; Manufacturer Part: R1206; spicePre: R; spiceSymbolName: Резистор 12кОм 0,25Вт 1% [1206]; Add into BOM: yes; FootprintName: R1206
R?#23 = Резистор 30,1кОм 0.25Вт 1% [1206]: Contributor: jordanjin; Convert to PCB: yes; UniqueId: ggec87a57a96243f491; Origin Footprint: R1206; Device: Резистор 30,1кОм 0.25Вт 1% [1206]; Symbol: Резистор 30,1кОм 0.25Вт 1% [1206]; Manufacturer Part: R1206; spicePre: R; spiceSymbolName: Резистор 12кОм 0,25Вт 1% [1206]; Add into BOM: yes; FootprintName: R1206
VD?#1 = Диод импульсный 1N4448 [SOD-123]: Manufacturer: YANGJIE; Manufacturer Part: 1N4448WQ; Contributor: jordanjin; Convert to PCB: yes; UniqueId: gge57ac2feeab7c7aa3; ModelId: 5a61cd31046d4447ba73169a45a0935b; Origin Footprint: SOD-123_L2.7-W1.6-LS3.7-RD-1; Device: Диод импульсный 1N4448 [SOD-123]; Symbol: Диод импульсный 1N4448 [SOD-123]; Supplier: LCSC; JLCPCB Part Class: Extended Part; spicePre: V; spiceSymbolName: Диод импульсный 1N4448 [SOD-123]; Add into BOM: yes; FootprintName: SOD-123_L2.7-W1.6-LS3.7-RD-1; ModelName: SOD-123_L2.7-W1.6-LS3.7-RD-1
VD?#2 = Диод импульсный 1N4448 [SOD-123]: Manufacturer: YANGJIE; Manufacturer Part: 1N4448WQ; Contributor: jordanjin; Convert to PCB: yes; UniqueId: gge7a9557551decdd95; ModelId: 5a61cd31046d4447ba73169a45a0935b; Origin Footprint: SOD-123_L2.7-W1.6-LS3.7-RD-1; Device: Диод импульсный 1N4448 [SOD-123]; Symbol: Диод импульсный 1N4448 [SOD-123]; Supplier: LCSC; JLCPCB Part Class: Extended Part; spicePre: V; spiceSymbolName: Диод импульсный 1N4448 [SOD-123]; Add into BOM: yes; FootprintName: SOD-123_L2.7-W1.6-LS3.7-RD-1; ModelName: SOD-123_L2.7-W1.6-LS3.7-RD-1
XP?#1 = Вилка на плату 280370-2 шаг 2.54мм: Manufacturer: TE Connectivity; Contributor: jordanjin; Convert to PCB: yes; UniqueId: gge4bccedc3e2fefce3; ModelId: 52348b5124d84a51b365c609ac2689aa; Origin Footprint: CONN-TH_280370-2; Device: Вилка на плату 280370-2 шаг 2.54мм; Symbol: Вилка на плату 280370-2 шаг 2.54мм; Supplier: LCSC; Manufacturer Part: 280370-2; JLCPCB Part Class: Extended Part; spicePre: X; spiceSymbolName: Вилка на плату 280370-2 шаг 2.54мм; Add into BOM: yes; FootprintName: CONN-TH_280370-2; ModelName: CONN-TH_280370-2
XP?#2 = Вилка на плату 826629-3 шаг 2.54мм: Manufacturer: TE Connectivity; Contributor: jordanjin; Convert to PCB: yes; UniqueId: ggebe5b07cfd5f401d4; Origin Footprint: HDR-TH_3P-P2.54-V-M-1; Device: Вилка на плату 826629-3 шаг 2.54мм; Symbol: Вилка на плату 826629-3 шаг 2.54мм; Supplier: LCSC; Manufacturer Part: 826629-3; JLCPCB Part Class: Extended Part; spicePre: X; spiceSymbolName: Вилка на плату 826629-3 шаг 2.54мм; Add into BOM: yes; FootprintName: HDR-TH_3P-P2.54-V-M-1